# Altium schematic sheet ADM32F036QN56Q.SchDoc
size A3
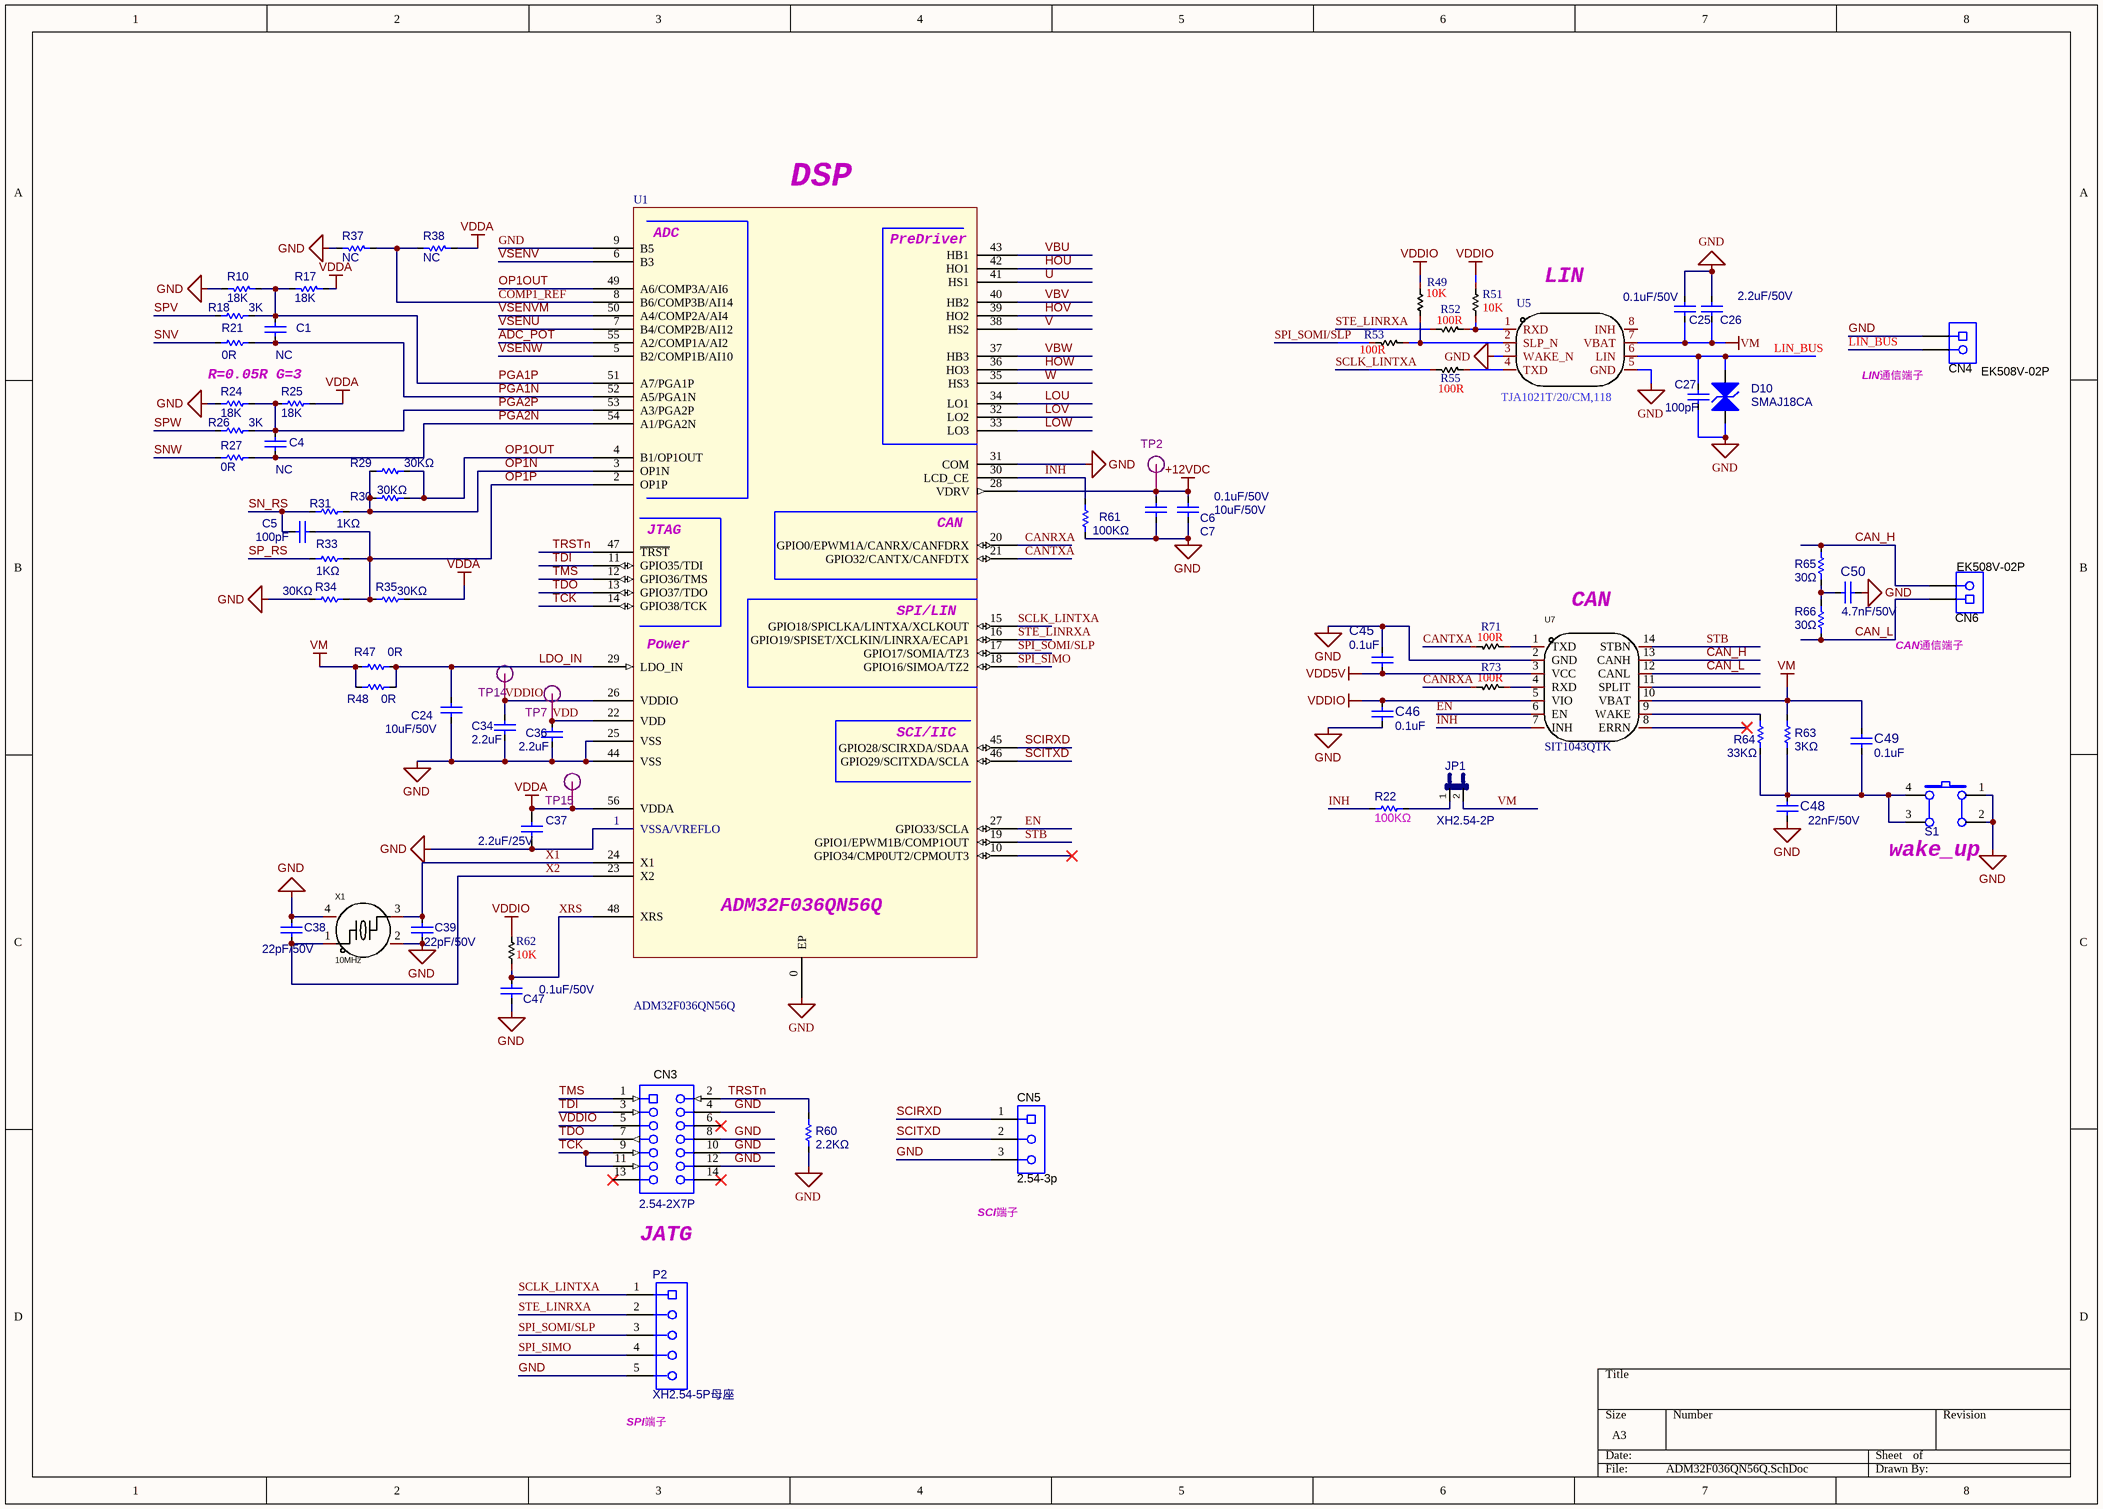
[diagram p0: ADM32F036QN56Q.SchDoc]

## Parts
C1  NC  [C0603]
C4  NC  [C0603]
C5  100pF  [C0603]
C6  0.1uF/50V  [C0603]
C7  10uF/50V  [C1206]
C24  10uF/50V  [C0805]
C25  0.1uF/50V  [C0603]
C26  2.2uF/50V  [C0603]
C27  100pF  [C0603]
C34  value 2.2uF  [C0603]  (hidden comment: 2.2uF/25V)
C36  value 2.2uF  [C0603]  (hidden comment: 2.2uF/25V)
C37  2.2uF/25V  [C0603]
C38  22pF/50V  [C0603]
C39  22pF/50V  [C0603]
C45  value 0.1uF  [C0603]  (hidden comment: 0.1uF/50V)
C46  value 0.1uF  [C0603]  (hidden comment: 0.1uF/50V)
C47  0.1uF/50V  [C0603]
C48  22nF/50V  [C0603]
C49  value 0.1uF  [C0603]  (hidden comment: 0.1uF/50V)
C50  4.7nF/50V  [C0603]
CN3  2.54-2X7P  [IDC14-L]
CN4  EK508V-02P  [J-EK508V-02P]
CN5  2.54-3p  [sip3a]
CN6  EK508V-02P  [J-EK508V-02P]
D10  SMAJ18CA  [SMA]
JP1  XH2.54-2P  [SIP2C]
P2  XH2.54-5P母座  [SIP5]
R10  18K  [R0603]
R17  18K  [R0603]
R18  3K  [R0603]
R21  0R  [R0603]
R22  100KΩ  [R0603]
R24  18K  [R0603]
R25  18K  [R0603]
R26  3K  [R0603]
R27  0R  [R0603]
R29  30KΩ  [R0603]
R30  30KΩ  [R0603]
R31  1KΩ  [R0603]
R33  1KΩ  [R0603]
R34  30KΩ  [R0603]
R35  30KΩ  [R0603]
R37  NC  [R0603]
R38  NC  [R0603]
R47  0R  [R1206]
R48  0R  [R1206]
R49  10K  [R0603]
R51  10K  [R0603]
R52  100R  [R0603]
R53  100R  [R0603]
R55  100R  [R0603]
R60  2.2KΩ  [R0603]
R61  100KΩ  [R0603]
R62  10K  [R0603]
R63  3KΩ  [R0603]
R64  33KΩ  [R0603]
R65  30Ω  [R1206]
R66  30Ω  [R1206]
R71  100R  [R0603]
R73  100R  [R0603]
S1  6x6x5  [SW-PB10]  (value not drawn)
TP2  12V  [TP-5000-RED]  (value not drawn)
TP7  VDD  [TP-5000-RED]  (value not drawn)
TP14  VDDIO  [TP-5000-RED]  (value not drawn)
TP15  VDDA  [TP-5000-RED]  (value not drawn)
U1  ADM32F036QN56Q  [QFN56-7X7-04P]
U5  TJA1021T/20/CM,118  [SO-8]
U7  SIT1043QTK  [VSON-14]
X1  10MHz  [XTAL_3225]

## Nets
+12VDC: C6.2 C7.1 TP2.1 U1.28(VDRV)
GND: C6.1 C7.2 C24.2 C25.2 C26.2 C27.2 C34.2 C36.1 C37.2 C38.1 C39.1 C45.1 C46.1 C47.1 C48.1 C50.1 CN3.4 CN3.8 CN3.10 CN3.12 CN4.1 CN5.3 D10.1(A) P2.5 R10.1 R24.1 R34.1 R37.1 R60.1 R61.1 S1.1 S1.2 U1.0(EP) U1.1(VSSA/VREFLO) U1.9(B5) U1.25(VSS) U1.31(COM) U1.44(VSS) U5.3(WAKE_N) U5.5(GND) U7.2(GND) X1.2(GND) X1.4(GND)
VDD5V: C45.2 U7.3(VCC)
VDDA: C37.1 R17.2 R25.2 R35.2 R38.2 TP15.1 U1.56(VDDA)
VDDIO: C34.1 C46.2 CN3.5 R49.1 R51.1 R62.1 TP14.1 U1.26(VDDIO) U7.5(VIO)
VM: C25.1 C26.1 C49.2 JP1.2 R47.2 R48.2 R63.2 U5.7(VBAT) U7.10(VBAT)
ADC_POT: U1.55(A2/COMP1A/AI2)
CAN_H: CN6.2 R65.2 U7.13(CANH)
CAN_L: CN6.1 R66.1 U7.12(CANL)
CANRXA: R73.1 U1.20(GPIO0/EPWM1A/CANRX/CANFDRX)
CANTXA: R71.1 U1.21(GPIO32/CANTX/CANFDTX)
COMP1_REF: R37.2 R38.1 U1.8(B6/COMP3B/AI14)
EN: U1.27(GPIO33/SCLA) U7.6(EN)
HOU: U1.42(HO1)
HOV: U1.39(HO2)
HOW: U1.36(HO3)
INH: R22.2 R61.2 U1.30(LCD_CE) U7.7(INH)
LDO_IN: C24.1 R47.1 R48.1 U1.29(LDO_IN)
LIN_BUS: C27.1 CN4.2 D10.2(K) U5.6(LIN)
LOU: U1.34(LO1)
LOV: U1.32(LO2)
LOW: U1.33(LO3)
OP1N: R29.1 R30.2 R31.2 U1.3(OP1N)
OP1OUT: R29.2 R30.1 U1.4(B1/OP1OUT) U1.49(A6/COMP3A/AI6)
OP1P: C5.2 R33.2 R34.2 R35.1 U1.2(OP1P)
PGA1N: C1.2 R21.1 U1.52(A5/PGA1N)
PGA1P: C1.1 R10.2 R17.1 R18.1 U1.51(A7/PGA1P)
PGA2N: C4.2 R27.1 U1.54(A1/PGA2N)
PGA2P: C4.1 R24.2 R25.1 R26.1 U1.53(A3/PGA2P)
SCIRXD: CN5.1 U1.45(GPIO28/SCIRXDA/SDAA)
SCITXD: CN5.2 U1.46(GPIO29/SCITXDA/SCLA)
SCLK_LINTXA: P2.1 R55.1 U1.15(GPIO18/SPICLKA/LINTXA/XCLKOUT)
SN_RS: C5.1 R31.1
SNV: R21.2
SNW: R27.2
SP_RS: R33.1
SPI_SIMO: P2.4 U1.18(GPIO16/SIMOA/TZ2)
SPI_SOMI/SLP: P2.3 R53.2 U1.17(GPIO17/SOMIA/TZ3)
SPV: R18.2
SPW: R26.2
STB: U1.19(GPIO1/EPWM1B/COMP1OUT) U7.14(STBN)
STE_LINRXA: P2.2 R52.1 U1.16(GPIO19/SPISET/XCLKIN/LINRXA/ECAP1)
TCK: CN3.9 CN3.11 U1.14(GPIO38/TCK)
TDI: CN3.3 U1.11(GPIO35/TDI)
TDO: CN3.7 U1.13(GPIO37/TDO)
TMS: CN3.1 U1.12(GPIO36/TMS)
TRSTn: CN3.2 R60.2 U1.47(~{TRST})
U: U1.41(HS1)
V: U1.38(HS2)
VBU: U1.43(HB1)
VBV: U1.40(HB2)
VBW: U1.37(HB3)
VDD: C36.2 TP7.1 U1.22(VDD)
VSENU: U1.7(B4/COMP2B/AI12)
VSENV: U1.6(B3)
VSENVM: U1.50(A4/COMP2A/AI4)
VSENW: U1.5(B2/COMP1B/AI10)
W: U1.35(HS3)
X1: C39.2 U1.24(X1) X1.3
X2: C38.2 U1.23(X2) X1.1
XRS: C47.2 R62.2 U1.48(XRS)
NetC48_2: C48.2 C49.1 R63.1 R64.1 S1.3 S1.4
NetC50_2: C50.2 R65.1 R66.2
NetJP1_1: JP1.1 R22.1
NetR49_2: R49.2 R53.1 U5.2(SLP_N)
NetR51_2: R51.2 R52.2 U5.1(RXD)
NetR55_2: R55.2 U5.4(TXD)
NetR64_2: R64.2 U7.9(WAKE)
NetR71_2: R71.2 U7.1(TXD)
NetR73_2: R73.2 U7.4(RXD)

Not connected (* = marked no-connect by the designer): CN3 6* 13* 14*; U1 10(GPIO34/CMP0UT2/CPMOUT3)*; U5 8(INH); U7 8(ERRN)* 11(SPLIT)

## Notes on the sheet
- DSP
- (near U5) LIN
- R=0.05R G=3
- (near CN4) LIN通信端子
- (near U7) CAN
- CAN通信端子
- (near S1) wake_up
- JATG
- (near CN5) SCI端子
- (near P2) SPI端子
- (in symbol ADM32F036QN56Q) ADC; PreDriver; CAN; JTAG; SPI/LIN; Power; SCI/IIC

## Library data of the parts
C1 C4 C5 C7 C24 C34 C36 C45 C46 C49 = Cap: 贴片电容; Published: 8-Jun-2000; LatestRevisionDate: 17-Jul-2002; LatestRevisionNote: Re-released for DXP Platform.; Publisher: Altium Limited
  C7: Value: 10uF/50V
C6 C25-C27 C47 = Cap: 贴片电容; Value: TDK C3216X7R1V106KT000E; Published: 8-Jun-2000; LatestRevisionDate: 17-Jul-2002; LatestRevisionNote: Re-released for DXP Platform.; Publisher: Altium Limited
C37 = C: 贴片电容
C38 C39 = Cap: COG贴片电容; Value: 100pF; Published: 8-Jun-2000; LatestRevisionDate: 17-Jul-2002; LatestRevisionNote: Re-released for DXP Platform.; Publisher: Altium Limited
C48 C50 = Cap: 贴片电容; Value: 0.1uF; Published: 8-Jun-2000; LatestRevisionDate: 17-Jul-2002; LatestRevisionNote: Re-released for DXP Platform.; Publisher: Altium Limited
CN3 = Receptacle_7X2: 简易牛角座连接器 卧式; Value: 2.54-2X7P
CN4 CN6 = CON2A: 连接器
CN5 = CON3A: 连接器
D10 = TVS: TVS二极管; Published: 8-Jun-2000; LatestRevisionDate: 17-Jul-2002; LatestRevisionNote: Re-released for DXP Platform.; Publisher: Altium Limited
JP1 = JP2: 连接器+跳线帽
P2 = CON5: 连接器
R10 R17 R18 R21 R22 R24-R27 R29-R31 R33-R35 R37 R38 R60 R61 R63-R66 = Res: 贴片电阻; Value: 1K; Published: 8-Jun-2000; LatestRevisionDate: 17-Jul-2002; LatestRevisionNote: Re-released for DXP Platform.; Publisher: Altium Limited
R47 R48 = Res: 贴片电阻; Published: 8-Jun-2000; LatestRevisionDate: 17-Jul-2002; LatestRevisionNote: Re-released for DXP Platform.; Publisher: Altium Limited
R49 R51 R62 = 10K/1%: ------; Symbol: Res; Add into BOM: yes; Origin Footprint: 0603R-X; Name: 10K; Device: 10K/1%; Published: 8-Jun-2000; LatestRevisionDate: 17-Jul-2002; LatestRevisionNote: Re-released for DXP Platform.; Publisher: Altium Limited; Convert to PCB: yes; Design Item ID: Res; Library Name: *
R52 R53 R55 R71 R73 = 10K/1%: ------; Name: 1K; Symbol: Res; Add into BOM: yes; Origin Footprint: 0603R-X; Device: 10K/1%; Published: 8-Jun-2000; LatestRevisionDate: 17-Jul-2002; LatestRevisionNote: Re-released for DXP Platform.; Publisher: Altium Limited; Convert to PCB: yes; Design Item ID: Res; Library Name: *
S1 = SW6X6X5mm: 贴片轻触开关 6x6x5mm
TP2 TP7 TP14 TP15 = TP: 测试点
U1 = ADM32F036QN56Q: 进芯电机驱动专用芯片
U5 = TJA1021T/20/CM,118: Add into BOM: yes; Protocol: LINbus; Receiver Hysteresis: 175mV; Supply Voltage: 5.5V ~ 27V; Name: TJA1021T/20/CM,118; Symbol: TJA1021T/20/CM,118; Device: TJA1021T/20/CM,118; LCSC Part Name: TJA1021T/20/CM,118; Supplier Part: C128810; Manufacturer Part: TJA1021T/20/CM,118; Supplier Footprint: SOIC-8; JLCPCB Part Class: Extended Part; Datasheet: https://atta.szlcsc.com/upload/public/pdf/source/20170914/C128810_1505359876382968052.pdf; Supplier: LCSC; Convert to PCB: yes; Operating Temperature: -
U7 = SIT1043QT: Manufacturer: SIT(о����); Add into BOM: yes; Symbol: SIT1043QT; Device: SIT1043QT; Supplier: LCSC; Supplier Part: C7433974; Manufacturer Part: SIT1043QT; JLCPCB Part Class: Extended Part; LCSC Part Name: SIT1043QT; Supplier Footprint: SOP-14; Datasheet: https://atta.szlcsc.com/upload/public/pdf/source/20230627/8FCFD20DE052EC106BC7CFF9B7B75632.pdf; Convert to PCB: yes
X1 = 3TJ410000ZYLBC: Manufacturer: JYJE(晶友嘉); Add into BOM: yes; Crystal Type: 贴片晶振; Normal temperature Frequency Tolerance: ±10ppm; External load capacitor: 20pF; Frequency Stability(Full temperature range): ±30ppm; Equivalent Series Resistance (ESR): 150Ω; Name: 10MHz; Symbol: 3TJ410000ZYLBC; Device: 3TJ410000ZYLBC; LCSC Part Name: 10MHz ±10ppm 20pF; Supplier Part: C2898998; Manufacturer Part: 3TJ410000ZYLBC; Supplier Footprint: SMD3225-4P; JLCPCB Part Class: Extended Part; Datasheet: https://atta.szlcsc.com/upload/public/pdf/source/20210922/C2898998_79DA4CA19A36528DCEC4420D32E637EE.pdf; Supplier: LCSC; Convert to PCB: yes; Value: 10MHz; Operating Temperature: -40℃~+85℃